# EAGLE design breakbeam (EAGLE 6.5.0)
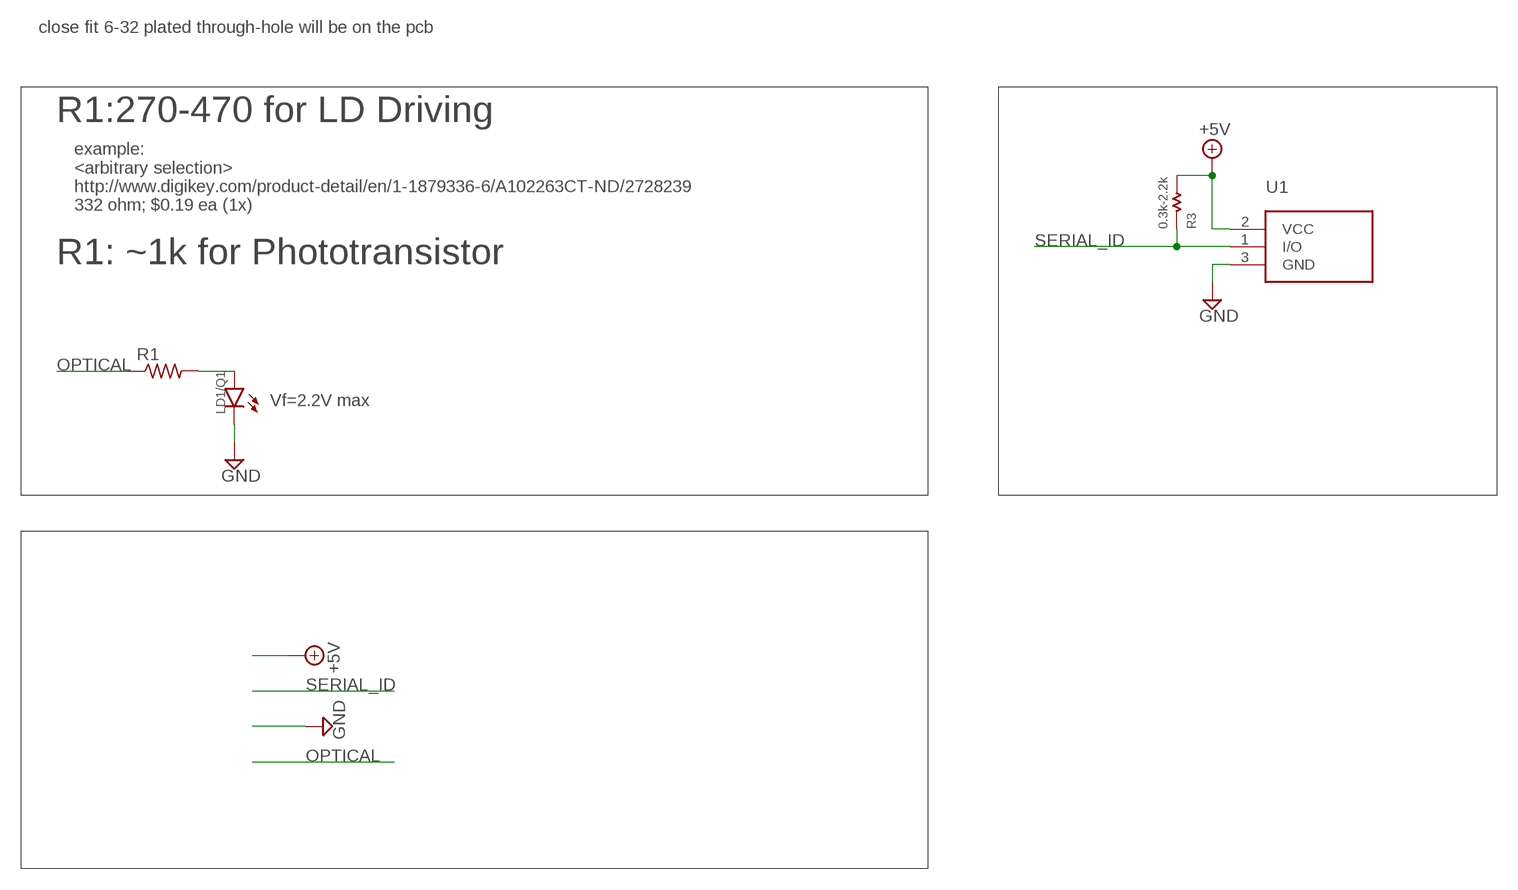
[diagram p0: schematic, sheet 1]

## Parts
LD1/Q1  LD_SIDELOOK_FACEDOWNEXTRA_SHORT_LEAD_MINIMIZED  [2LEAD_H_FACEDOWN_XSHORT_MIN]
R1  R-US_R0603  [R0603]
R3  0.3k-2.2k  GHOST_RESISTOR  [GHOST_0.075]
U1  DS2411  [SOT-23-3]

## Nets
+5V: R3.P$2(PIN2) U1.2(VCC)
GND: LD1/Q1.1(C) U1.3(GND)
N$1: LD1/Q1.2(A) R1.2
OPTICAL: R1.1
SERIAL_ID: R3.P$1(PIN1) U1.1(I/O)

## Notes on the sheet
- close fit 6-32 plated through-hole will be on the pcb
- R1:270-470 for LD Driving
- example: 
  <arbitrary selection>
  http://www.digikey.com/product-detail/en/1-1879336-6/A102263CT-ND/2728239
  332 ohm; $0.19 ea (1x)
- R1: ~1k for Phototransistor
- Vf=2.2V max

## Library data of the parts
LD1/Q1 = RoboJackets-Diodes:LD_SIDELOOK_FACEDOWN
R1 = rcl:R-US_: RESISTOR, American symbol
R3 = RoboJackets-Resistors:GHOST_RESISTOR
U1 = RoboJackets-ICs:DS2411

## Board
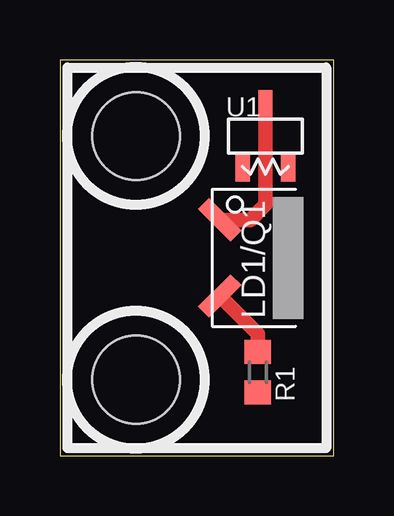
[diagram p1: board, top side]

Size 11.43 x 16.51 mm. Coordinates in mm from the lower left corner, seen from the top.
Outline: 0,0 11.43,0 11.43,16.51 0,16.51 0,0
Copper layers (1*16): Top 0.035mm / dielectric 1.5mm / Bottom 0.035mm
Design rules "default": minimum track width 10mil, minimum drill 0.6mm, track to track 8mil, track to pad 8mil, pad to pad 8mil, via to via 8mil, smd to smd 8mil, copper to edge 40mil, drill to drill 8mil, minimum pad ring 10mil, minimum via ring 8mil, stop-mask expansion 4mil, vias tented up to drill 0mil, thermal gap 10mil
Holes 3.66 mm at 3.17,3.17 3.17,13.34

### Footprints (pad centres in the part's own frame; a part is rotated, then mirrored left to right if it is on the bottom)
2LEAD_H_FACEDOWN_XSHORT_MIN = smd 1.905 x 0.635 rotated 315: 1 -0.318,1.587 | smd 1.905 x 0.635 rotated 45: 2 -0.318,-1.587
R0603 = smd 1 x 1.1: 1 -0.85,0; 2 0.85,0
GHOST_0.075 = smd 0 x 0: P$1 -0.953,0; P$2 0.953,0
SOT-23-3 = smd 0.6 x 1.2: 1 0.95,1.306; 2 -0.95,1.306; 3 0,-1.306

### Placement (x,y rotation side)
LD1/Q1  6.99,8.26 0 top
R1  8.26,3.49 90 top
R3  8.57,12.06 0 top
U1  8.57,13.34 180 top

### Tracks (layer width: path | path; a pad name or v marks a point on that pad's centre or on a via)
+5V  (1 unrouted)
GND
  Top 0.61: LD1/Q1.1 7.94,9.84 8.57,10.48 U1.3
N$1
  Top 0.61: R1.2 8.26,5.08 LD1/Q1.2
SERIAL_ID  (1 unrouted)